# Altium project Pulse Counter_V1.0.PrjPcb
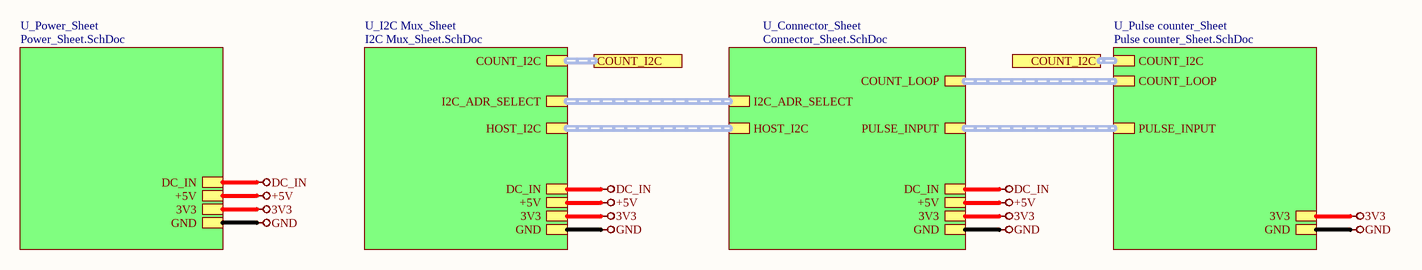
[diagram p0: Top-Sheet.SchDoc]
5 sheets, 96 parts. Net scope: hierarchical (ports join the sheet entries above them; power ports are global).
Board file: PCB1.PcbDoc
Sheets:
  Top-Sheet.SchDoc
    U_Power_Sheet = Power_Sheet.SchDoc
    U_I2C Mux_Sheet = I2C Mux_Sheet.SchDoc
    U_Connector_Sheet = Connector_Sheet.SchDoc
    U_Pulse counter_Sheet = Pulse counter_Sheet.SchDoc

## Sheet Top-Sheet.SchDoc
size A4; SheetNumber: 1; SheetTotal: 5

### Sub-sheets
U_Connector_Sheet = Connector_Sheet.SchDoc: PULSE_INPUT (harness PULSE_INPUT), COUNT_LOOP (harness COUNT_LOOP), I2C_ADR_SELECT (harness I2C_ADR_SELECT), HOST_I2C (harness HOST_I2C), DC_IN, 3V3, GND, +5V
U_I2C Mux_Sheet = I2C Mux_Sheet.SchDoc: COUNT_I2C (harness COUNT_I2C), I2C_ADR_SELECT (harness I2C_ADR_SELECT), HOST_I2C (harness HOST_I2C), DC_IN, 3V3, GND, +5V
U_Power_Sheet = Power_Sheet.SchDoc: DC_IN, +5V, 3V3, GND
U_Pulse counter_Sheet = Pulse counter_Sheet.SchDoc: COUNT_I2C (harness COUNT_I2C), COUNT_LOOP (harness COUNT_LOOP), PULSE_INPUT (harness PULSE_INPUT), 3V3, GND

### Ports
COUNT_I2C

### Nets
3V3: sheet U_Power_Sheet/3V3, sheet U_I2C Mux_Sheet/3V3, sheet U_Connector_Sheet/3V3, sheet U_Pulse counter_Sheet/3V3
+5V: sheet U_Power_Sheet/+5V, sheet U_I2C Mux_Sheet/+5V, sheet U_Connector_Sheet/+5V
DC_IN: sheet U_Power_Sheet/DC_IN, sheet U_I2C Mux_Sheet/DC_IN, sheet U_Connector_Sheet/DC_IN
GND: sheet U_Power_Sheet/GND, sheet U_I2C Mux_Sheet/GND, sheet U_Connector_Sheet/GND, sheet U_Pulse counter_Sheet/GND

### Buses and harness runs
harness port COUNT_I2C = sheet U_I2C Mux_Sheet/COUNT_I2C
harness port COUNT_I2C = sheet U_Pulse counter_Sheet/COUNT_I2C
harness sheet U_Connector_Sheet/COUNT_LOOP = sheet U_Pulse counter_Sheet/COUNT_LOOP
harness sheet U_Connector_Sheet/HOST_I2C = sheet U_I2C Mux_Sheet/HOST_I2C
harness sheet U_Connector_Sheet/I2C_ADR_SELECT = sheet U_I2C Mux_Sheet/I2C_ADR_SELECT
harness sheet U_Connector_Sheet/PULSE_INPUT = sheet U_Pulse counter_Sheet/PULSE_INPUT

### Notes on the sheet
- File:
- Title:
- Date:
- Page
- Num:
- Total:
- Drawn By: Huzaifa Ali

## Sheet Power_Sheet.SchDoc
size A4; SheetNumber: 2; SheetTotal: 5
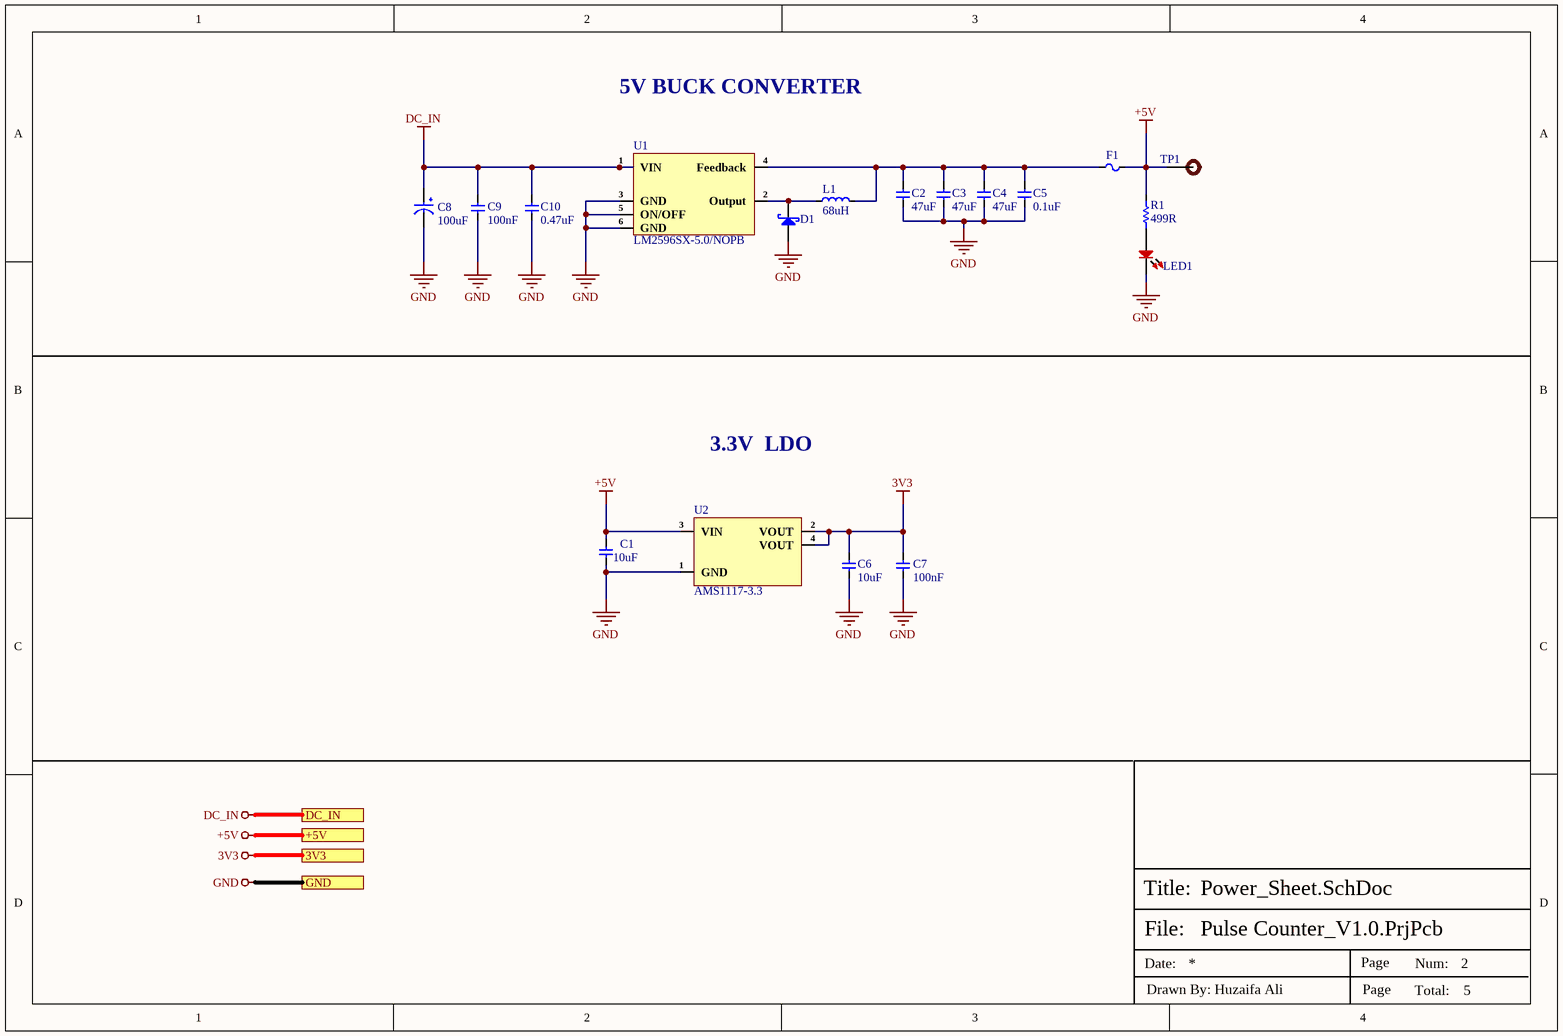
[diagram p1: Power_Sheet.SchDoc]

### Parts
C1  10uF  [Cap-0603]
C2  47uF  [Cap-1206]
C3  47uF  [Cap-1206]
C4  47uF  [Cap-1206]
C5  0.1uF  [Cap-0603]
C6  10uF  [Cap-0603]
C7  100nF  [cap-0402]
C8  100uF  [UUD-100uF-8mmDia]
C9  100nF  [cap-0402]
C10  0.47uF  [Cap-0603]
D1  SS54B-HF  [SMB_]  (value not drawn)
F1  1206L300SLTHYR  [Fuse 1206 (3216 Metric)]  (value not drawn)
L1  68uH  [FCH1365-680M]
LED1  RED  [LED-0603]  (value not drawn)
R1  499R  [Res-0402]
TP1  TEST POINT  [Test-point]  (value not drawn)  (no BOM)
U1  LM2596SX-5.0/NOPB  [DDPAK]
U2  AMS1117-3.3  [SOT- 223]

### Ports
3V3, +5V, DC_IN, GND

### Nets
3V3: C6.2 C7.2 U2.2(VOUT) U2.4(VOUT) ; port 3V3
+5V: C1.2 F1.2 R1.1 TP1.1 U2.3(VIN) ; port +5V
DC_IN: C8.1 C9.2 C10.2 U1.1(VIN) ; port DC_IN
GND: C1.1 C2.1 C3.1 C4.1 C5.1 C6.1 C7.1 C8.2 C9.1 C10.1 D1.1(A) LED1.2 U1.3(GND) U1.5(ON/OFF) U1.6(GND) U2.1(GND) ; port GND
NetC2_2: C2.2 C3.2 C4.2 C5.2 F1.1 L1.2 U1.4(Feedback)
NetD1_2: D1.2(K) L1.1 U1.2(Output)
NetLED1_1: LED1.1 R1.2

### Notes on the sheet
- 5V BUCK CONVERTER
- 3.3V  LDO
- File:
- Title:
- Date:
- Page
- Num:
- Total:
- Drawn By: Huzaifa Ali

### Library data of the parts
C1 C6 = C1608X5R1E106M080AC: CAP CER 10UF 25V X5R 0603; Manufacturer: TDK; Dielectric Material: Ceramic; Tolerance: 20%; Item Type: Capacitor; Supplier 1: Digi-Key; Manufacturer Part Number: C1608X5R1E106M080AC; Stock 1: 61681; Pricing 1: 1=0.96, 10=0.704, 100=0.483, 500=0.38238, 1000=0.322 (USD); Mount: Surface Mount; Case/Package: 0603; Weight: 7.1E-05oz; Case Code (Imperial): 0603; Case Code (Metric): 1608; Min Operating Temperature: -55°C; Max Operating Temperature: 85°C; Capacitance: 10uF; Packaging: Tape and Reel; Voltage Rating: 25V; Voltage Rating (DC): 25V; Termination: SMD/SMT; Package Quantity: 1; Dielectric: X5R; Composition: Ceramic; Length: 1.6mm; Height: 0.8mm; Width: 0.8mm; Thickness: 0.039inch; Depth: 0.8mm; Lead Free: Lead Free; REACH SVHC: No SVHC; Supplier Part Number 1: 445-9015-1-ND; LCSC Part Number: C2168289
C2-C4 = GRM31CR61E476ME44L: CAP CER 47UF 25V X5R 1206; Manufacturer: Murata; Tolerance: 20%; Item Type: Capacitor; Supplier 1: Digi-Key; Manufacturer Part Number: GRM31CR61E476ME44L; RoHS: Yes; Category: Ceramic Capacitors; Capacitance: 47uF; Voltage Rating (DC): 25V; Dielectric: X5R; Length: 3.2mm; Width: 1.6mm; Thickness: 1.6mm; ComponentLink1URL: https://search.murata.co.jp/Ceramy/image/img/A01X/partnumbering_e_01.pdf?src-supplier=Digi-Key; ComponentLink1Description: https://search.murata.co.jp/Ceramy/image/img/A01X/partnumbering_e_01.pdf?src-supplier=Digi-Key; Supplier Part Number 1: 490-16268-2-ND; LCSC Part Number: C403725
C5 = CL10B104KB8WPNC: CAP CER 0.1UF 50V X7R 0603; Item Type: Capacitor; Material: 4241ConductorMaterial; Value: 100nF; Tolerance: 10%; LCSC Part Number: C307348; ComponentLink1Description: LCSC; Supplier: Rs; Supplier Part Number: 2575919; RoHS: Yes; Category: Ceramic Capacitors; Stock: 400; Pricing: 100=0.021, 500=0.019, 1000=0.015, 2000=0.01 (GBP); Mounting Technology: Surface Mount; Case/Package: 0603; Case Code (Metric): 1608; Case Code (Imperial): 0603; Min Operating Temperature: -55°C; Max Operating Temperature: 125°C; Packaging: Cut Tape; Voltage Rating: 50V; Series: CL; Voltage Rating (DC): 50V; Height: 900um; Ratings: AEC-Q200; RoHS Compliant: Yes; Lead Free: 5697LeadFree; ComponentLink2URL: http://www.farnell.com/datasheets/2710560.pdf?src-supplier=Farnell; ComponentLink2Description: http://www.farnell.com/datasheets/2710560.pdf?src-supplier=Farnell; ComponentLink3URL: http://www.samsungsem.com/kr/support/product-search/mlcc/CL10B104KB8WPNC.jsp?src-supplier=Digi-Key; ComponentLink3Description: http://www.samsungsem.com/kr/support/product-search/mlcc/CL10B104KB8WPNC.jsp?src-supplier=Digi-Key; ComponentLink4URL: http://www.farnell.com/datasheets/2710560.pdf?src-supplier=Element14; ComponentLink4Description: http://www.farnell.com/datasheets/2710560.pdf?src-supplier=Element14; ComponentLink5URL: https://datasheet.octopart.com/CL10B104KB8WPNC-Samsung-Electro-Mechanics-datasheet-120093645.pdf?src-supplier=Future+Electronics; ComponentLink5Description: https://datasheet.octopart.com/CL10B104KB8WPNC-Samsung-Electro-Mechanics-datasheet-120093645.pdf?src-supplier=Future+Electronics; ComponentLink6URL: http://www.farnell.com/datasheets/2710560.pdf?src-supplier=Newark; ComponentLink6Description: http://www.farnell.com/datasheets/2710560.pdf?src-supplier=Newark; ComponentLink7URL: http://www.samsungsem.com/servlet/FileDownload?type=spec&file=CL10B104KB8WPNC.pdf&src-supplier=Avnet; ComponentLink7Description: http://www.samsungsem.com/servlet/FileDownload?type=spec&file=CL10B104KB8WPNC.pdf&src-supplier=Avnet; ComponentLink8URL: https://datasheet.octopart.com/CL10B104KB8WPNC-Samsung-datasheet-8326407.pdf?src-supplier=TME; ComponentLink8Description: https://datasheet.octopart.com/CL10B104KB8WPNC-Samsung-datasheet-8326407.pdf?src-supplier=TME
C7 C9 = C1005X7R1H104KT000F: CAP CER 0.1UF 50V X7R 0402; Manufacturer: TDK; Tolerance: 10%; Voltage: 25V; Item Type: Capacitor; Supplier 1: Avnet; Manufacturer Part Number: C1005X7R1H104KT000F; RoHS: No; Category: Ceramic Capacitors; Dielectric: X7R; Supplier Part Number 1: C1005X7R1H104KT000F; LCSC Part Number: C361198; ComponentLink1Description: LCSC; ComponentLink1URL: https://www.lcsc.com/product-detail/Multilayer-Ceramic-Capacitors-MLCC-SMD-SMT_TDK-C1005X7R1H104KT000F_C361198.html
C8 = UUD1H101MNL1GS: CAP ALUM 100UF 20% 50V SMD; Manufacturer: Nichicon; Dielectric Material: Aluminium; Ripple Current: 300mA; Life (Hours): 5000Hour; Impedance: 340mR; Leakage Current: 3uA; Dissipation Factor: 0.14%; Lead Diameter: 1.1mm; Item Type: Capacitor; Supplier 1: Digi-Key; Manufacturer Part Number: UUD1H101MNL1GS; RoHS: Yes; Category: Aluminum Electrolytic Capacitors; Pricing 1: 1=0.62000, 10=0.44000, 50=0.33300, 100=0.29000 (USD); Case/Package: Radial; Number of Pins: 2; Min Operating Temperature: -55°C; Max Operating Temperature: 105°C; Tolerance: 20%; Capacitance: 100uF; Ripple Current (AC): 300mA; Voltage Rating (DC): 50V; Package Quantity: 500; Packaging: Tape and Reel; Voltage Rating: 50V; Termination: SMD/SMT; Voltage: 50V; Series: UD; Construction: Cylindrical; Diameter: 8mm; Length: 10mm; Height: 10mm; Lead Pitch: 3.1mm; Height - Seated (Max): 0.394inch; Radiation Hardening: No; REACH SVHC: No SVHC; Lead Free: Lead Free; RoHS Compliant: Yes; ComponentLink1URL: https://datasheet.ciiva.com/6002/66055-6002224.pdf?src-supplier=Farnell; ComponentLink1Description: https://datasheet.ciiva.com/6002/66055-6002224.pdf?src-supplier=Farnell; ComponentLink2URL: https://datasheet.ciiva.com/11781/0900766b80fa39e7-11781901.pdf?src-supplier=RSComponents; ComponentLink2Description: https://datasheet.ciiva.com/11781/0900766b80fa39e7-11781901.pdf?src-supplier=RSComponents; ComponentLink3URL: https://datasheet.ciiva.com/97/e-ud-97939.pdf?src-supplier=Digi-Key; ComponentLink3Description: https://datasheet.ciiva.com/97/e-ud-97939.pdf?src-supplier=Digi-Key; ComponentLink4URL: https://datasheet.ciiva.com/97/e-ud-97940.pdf?src-supplier=Digi-Key; ComponentLink4Description: https://datasheet.ciiva.com/97/e-ud-97940.pdf?src-supplier=Digi-Key; ComponentLink5URL: https://datasheet.ciiva.com/97/e-ud-97941.pdf?src-supplier=Digi-Key; ComponentLink5Description: https://datasheet.ciiva.com/97/e-ud-97941.pdf?src-supplier=Digi-Key; ComponentLink6URL: https://datasheet.ciiva.com/28458/e-ud-28458117.pdf?src-supplier=Element14; ComponentLink6Description: https://datasheet.ciiva.com/28458/e-ud-28458117.pdf?src-supplier=Element14; ComponentLink7URL: https://datasheet.ciiva.com/28458/1910936-28458133.pdf?src-supplier=Element14; ComponentLink7Description: https://datasheet.ciiva.com/28458/1910936-28458133.pdf?src-supplier=Element14; ComponentLink8URL: https://datasheet.ciiva.com/5362/e-ud-5362134.pdf?src-supplier=Mouser; ComponentLink8Description: https://datasheet.ciiva.com/5362/e-ud-5362134.pdf?src-supplier=Mouser; ComponentLink9URL: https://datasheet.ciiva.com/7781/66055-7781450.pdf?src-supplier=Element14; ComponentLink9Description: https://datasheet.ciiva.com/7781/66055-7781450.pdf?src-supplier=Element14; ComponentLink10URL: https://datasheet.ciiva.com/17354/e-ud-17354671.pdf?src-supplier=Avnet+Europe; ComponentLink10Description: https://datasheet.ciiva.com/17354/e-ud-17354671.pdf?src-supplier=Avnet+Europe; Supplier Part Number 1: 493-2306-6-ND; LCSC Part Number: C116241
C10 = CL10A474KB8NNNC: CAP CER 0.47UF 50V X5R 0603; Manufacturer: Samsung; Tolerance: 10%; Capacitance: 470nF; Supplier 1: Arrow Electronics; Manufacturer Part Number: CL10A474KB8NNNC; RoHS: Yes; Category: Ceramic Capacitors; Stock 1: 196000; Pricing 1: 200000=0.04290, 300000=0.04250, 400000=0.04210, 500000=0.04170, 1000000=0.04120, 2000000=0.04080 (USD); Mount: Surface Mount; Case/Package: 0603; Case Code (Metric): 1608; Case Code (Imperial): 0603; Min Operating Temperature: -55°C; Max Operating Temperature: 85°C; Packaging: Tape and Reel; Package Quantity: 1; Voltage Rating: 50V; Dielectric: X5R; Series: CL; Construction: Flat; Voltage Rating (DC): 50V; Length: 1.6mm; Width: 0.031inch; Height: 0.8mm; Thickness: 0.035inch; Depth: 0.8mm; Radiation Hardening: No; RoHS Compliant: Yes; Lead Free: Lead Free; ComponentLink1URL: https://datasheet.ciiva.com/25798/cl10a474kb8nnnc-25798516.pdf?src-supplier=Digi-Key; ComponentLink1Description: https://datasheet.ciiva.com/25798/cl10a474kb8nnnc-25798516.pdf?src-supplier=Digi-Key; ComponentLink2URL: https://datasheet.ciiva.com/15195/getdatasheetpartid-353290-15195713.pdf?src-supplier=Verical; ComponentLink2Description: https://datasheet.ciiva.com/15195/getdatasheetpartid-353290-15195713.pdf?src-supplier=Verical; Supplier Part Number 1: CL10A474KB8NNNC; LCSC Part Number: C170149
D1 = SS54B-HF: DIODE SCHOTTKY 5A 40V SMB; Manufacturer: Comchip; Supplier 1: Mouser; Manufacturer Part Number: SS54B-HF; RoHS: No; Stock 1: 2862; Pricing 1: 1=0.56000, 10=0.32900, 50=0.32900, 100=0.17100, 1000=0.11900, 10000=0.09000 (USD); Supplier Part Number 1: 750-SS54B-HF; LCSC Part Number: C3759253
F1 = 1206L300SLTHYR: PTC RESET FUSE 6V 3A 1206; Manufacturer: Littelfuse; Max Current Rating: 50A; Resistance: 20mR; Power Dissipation: 800mW; Trip Current: 6A; Time to Trip: 4s; Approvals: UL,TUV; Supplier 1: Arrow Electronics; Manufacturer Part Number: 1206L300SLTHYR; RoHS: Yes; Category: PTC Resettable Fuses; Stock 1: 4000; Pricing 1: 4000=0.60290 (USD); Case/Package: 1206; Case Code (Metric): 3216; Case Code (Imperial): 1206; Min Operating Temperature: -40°C; Max Operating Temperature: 85°C; Package Quantity: 4000; Packaging: Tape and Reel; Termination: SMD/SMT; Max Voltage Rating (DC): 6V; Hold Current: 3A; Voltage Rating (DC): 6V; Operating Supply Voltage: 6V; Series: POLY-FUSE®, LoRho™; Lead Free: Lead Free; RoHS Compliant: Yes; ComponentLink1URL: https://datasheet.ciiva.com/7438/littelfuse-lorho-ptc-7438567.pdf?src-supplier=Digi-Key; ComponentLink1Description: https://datasheet.ciiva.com/7438/littelfuse-lorho-ptc-7438567.pdf?src-supplier=Digi-Key; ComponentLink2URL: https://datasheet.ciiva.com/7438/littelfuse-lorho-ptc-7438569.pdf?src-supplier=Digi-Key; ComponentLink2Description: https://datasheet.ciiva.com/7438/littelfuse-lorho-ptc-7438569.pdf?src-supplier=Digi-Key; ComponentLink3URL: https://datasheet.ciiva.com/7438/littelfuse-lorho-ptc-7438565.pdf?src-supplier=Digi-Key; ComponentLink3Description: https://datasheet.ciiva.com/7438/littelfuse-lorho-ptc-7438565.pdf?src-supplier=Digi-Key; Supplier Part Number 1: 1206L300SLTHYR; LCSC Part Number: C207041; Item Type: Fuse
L1 = FCH1365-680M: 4.5A 68uH Molding Choke ±20% 5.5A SMD,13.7x12.8mm Power Inductors ROHS; Manufacturer: FANGCHENG; Manufacturer Part Number: FCH1365-680M; Package: SMD,13.7x12.8mm; LCSC Part Number: C20415558; Item Type: Inductor; ComponentLink1Description: LCSC; ComponentLink1URL: https://www.lcsc.com/product-detail/Power-Inductors_FANGCHENG-FCH1365-680M_C20415558.html
LED1 = NCD0603R3: RED LED 0603 Light Emitting Diodes; Manufacturer: Foshan NationStar Optoelectronics; Manufacturer Part Number: NCD0603R3; Package: 0603; Item Type: LED; LCSC Part Number: C3151730; ComponentLink1Description: LCSC; ComponentLink1URL: https://www.lcsc.com/product-detail/Light-Emitting-Diodes-LED_Foshan-NationStar-Optoelectronics-NCD0603R3_C3151730.html
R1 = RC0402FR-07499RL: RES 499 OHM 1% 1/16W 0402; Manufacturer: Yageo; Power Rating: 62.5mW; Voltage Rating: 50V; Max Power Dissipation: 63mW; Temperature Coefficient: 100ppm/°C; Supplier 1: Mouser; Manufacturer Part Number: RC0402FR-07499RL; RoHS: Yes; Category: Chip SMD Resistors; Stock 1: 936879; Pricing 1: 1=0.10000, 10=0.01200, 50=0.01200, 100=0.00500, 1000=0.00300, 10000=0.00100 (USD); Case/Package: 0402; Case Code (Metric): 1005; Case Code (Imperial): 0402; Size Code: 0402; Min Operating Temperature: -55°C; Max Operating Temperature: 155°C; Resistance: 499R; Tolerance: 1%; Package Quantity: 1; Packaging: Tape and Reel; Resistor Type: Thick Film; Number of Terminations: 2; Termination: SMD/SMT; Voltage Rating (DC): 50V; Features: Moisture Resistant; Series: RC; Resistance Tolerance: 1%; Construction: Rectangular; Length: 1mm; Width: 0.02inch; Height: 0.016inch; Depth: 0.5mm; RoHS Compliant: Yes; REACH SVHC: No SVHC; Military Standard: Not; Lead Free: Lead Free; ComponentLink1URL: https://datasheet.ciiva.com/2453/pyu-r-int-thick-7-2453539.pdf?src-supplier=Digi-Key; ComponentLink1Description: https://datasheet.ciiva.com/2453/pyu-r-int-thick-7-2453539.pdf?src-supplier=Digi-Key; ComponentLink2URL: https://datasheet.ciiva.com/2453/pyu-r-int-thick-7-2453540.pdf?src-supplier=Digi-Key; ComponentLink2Description: https://datasheet.ciiva.com/2453/pyu-r-int-thick-7-2453540.pdf?src-supplier=Digi-Key; ComponentLink3URL: https://datasheet.ciiva.com/2453/pyu-r-int-thick-7-2453538.pdf?src-supplier=Digi-Key; ComponentLink3Description: https://datasheet.ciiva.com/2453/pyu-r-int-thick-7-2453538.pdf?src-supplier=Digi-Key; Supplier Part Number 1: 603-RC0402FR-07499RL; LCSC Part Number: C137970
TP1 = TEST POINT: Test Point ON; Item Type: TEST POINT
U1 = LM2596SX-5.0/NOPB: IC REG BUCK 5V 3A TO263; Manufacturer: TI National Semiconductor; Min Input Voltage: 4.5V; Max Supply Voltage: 40V; Number of Outputs: 1; Switching Frequency: 150kHz; Efficiency: 80%; Synchronous Rectifier: No; Quiescent Current: 5mA; Output Type: Fixed; Output Configuration: Positive; Number of Channels: 1NUMBER; Supplier: Mouser; LCSC Part Number: C10002; Manufacturer Part Number: LM2596SX-5.0/NOPB; RoHS: Yes; Item Type: IC; Stock: 2657; Pricing: 1=5.76, 10=4.08, 50=4.08, 100=3.71, 1000=3.28, 10000=3.28 (USD); Mounting Technology: Surface Mount; Case/Package: TO-263; Pins: 5; Min Operating Temperature: -40°C; Max Operating Temperature: 125°C; Output Voltage: 5V; Output Current: 3A; Packaging: Tape and Reel; Package Quantity: 500; Nominal Output Voltage: 5V; Min Output Voltage: 5V; Series: SIMPLE SWITCHER®; Thickness: 4.58mm; Reach SVHC Compliant: No; Lead Free: Contains Lead
U2 = AMS1117-3.3: SOT-223 Linear Voltage Regulators (LDO) ROHS; Manufacturer: GUOXIN JIAPIN SEMICONDUCTOR; Item Type: IC; Manufacturer Part Number: AMS1117-3.3; Package: SOT-223; LCSC Part Number: C2992570; ComponentLink1Description: LCSC; ComponentLink1URL: https://www.lcsc.com/product-detail/Linear-Voltage-Regulators-LDO_GUOXIN-JIAPIN-SEMICONDUCTOR-AMS1117-3-3_C2992570.html

## Sheet I2C Mux_Sheet.SchDoc
size A4; SheetNumber: 4; SheetTotal: 5
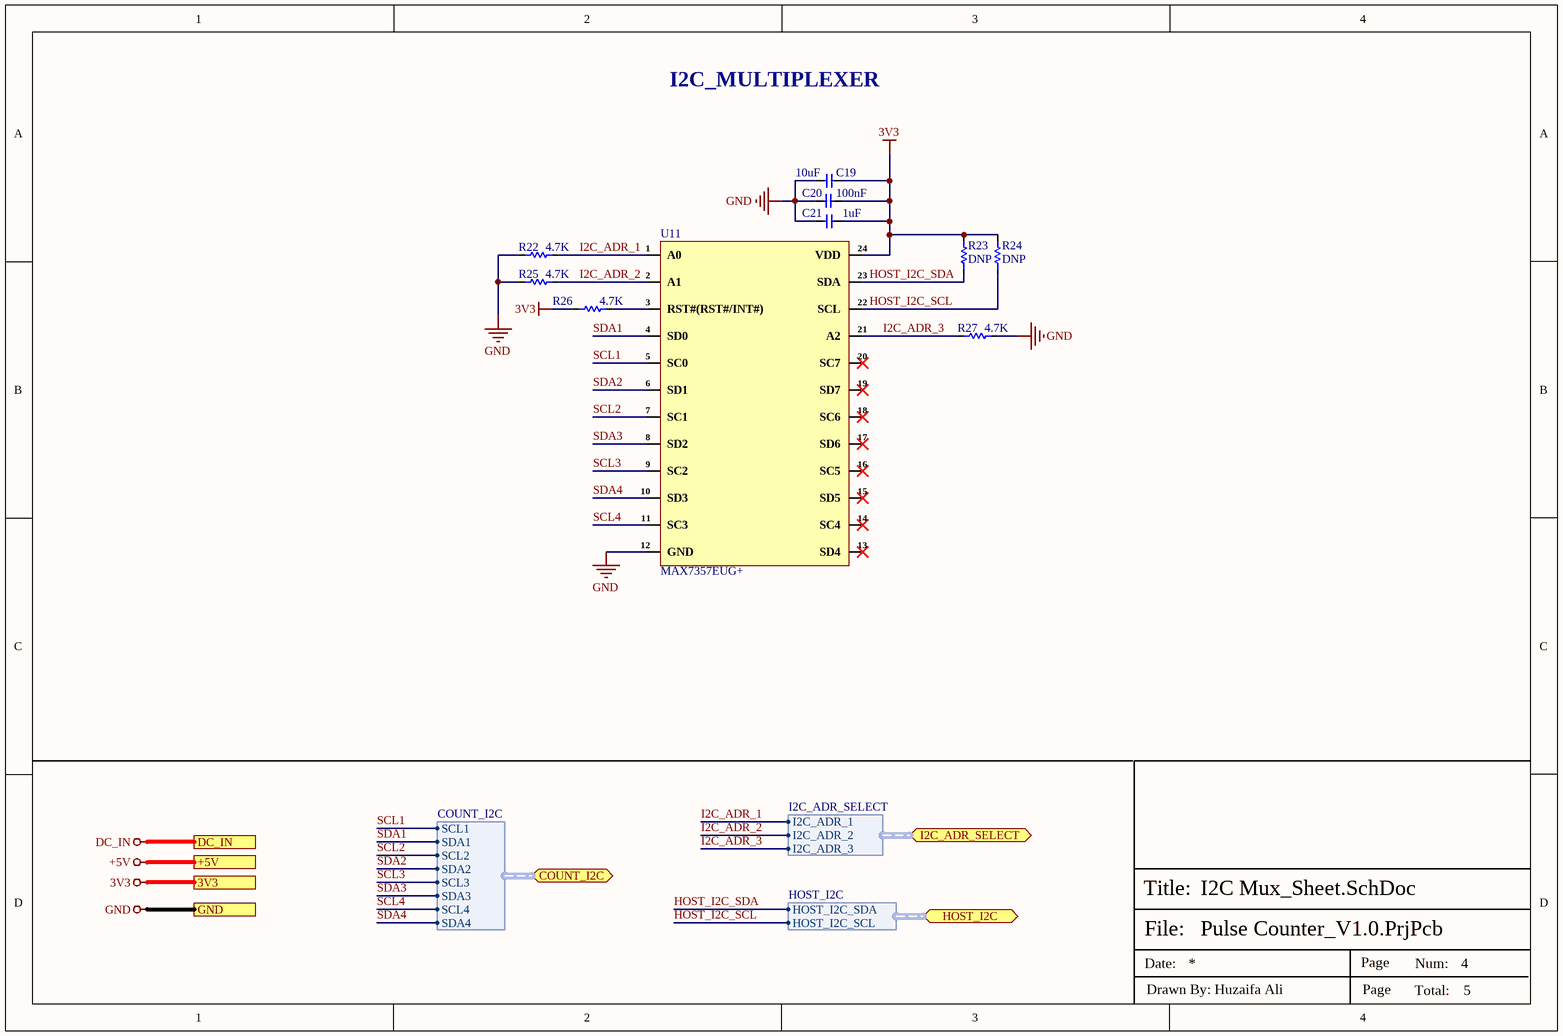
[diagram p2: I2C Mux_Sheet.SchDoc]

### Parts
C19  10uF  [Cap-0603]
C20  100nF  [cap-0402]
C21  1uF  [Cap-0402]
R22  4.7K  [Res-0402]
R23  DNP  [Res-0402]
R24  DNP  [Res-0402]
R25  4.7K  [Res-0402]
R26  4.7K  [Res-0402]
R27  4.7K  [Res-0402]
U11  MAX7357EUG+  [24-TSSOP]

### Ports
3V3, +5V, COUNT_I2C (bidir, harness COUNT_I2C), DC_IN, GND, HOST_I2C (bidir, harness HOST_I2C), I2C_ADR_SELECT (bidir, harness I2C_ADR_SELECT)

### Harnesses
COUNT_I2C: SCL1, SDA1, SCL2, SDA2, SCL3, SDA3, SCL4, SDA4
I2C_ADR_SELECT: I2C_ADR_1, I2C_ADR_2, I2C_ADR_3
HOST_I2C: HOST_I2C_SDA, HOST_I2C_SCL

### Nets
3V3: C19.1 C20.2 C21.1 R23.2 R24.2 R26.1 U11.24(VDD) ; port 3V3
GND: C19.2 C20.1 C21.2 R22.1 R25.1 R27.2 U11.12(GND) ; port GND
HOST_I2C_SCL: R24.1 U11.22(SCL) ; port HOST_I2C.HOST_I2C_SCL
HOST_I2C_SDA: R23.1 U11.23(SDA) ; port HOST_I2C.HOST_I2C_SDA
I2C_ADR_1: R22.2 U11.1(A0) ; port I2C_ADR_SELECT.I2C_ADR_1
I2C_ADR_2: R25.2 U11.2(A1) ; port I2C_ADR_SELECT.I2C_ADR_2
I2C_ADR_3: R27.1 U11.21(A2) ; port I2C_ADR_SELECT.I2C_ADR_3
SCL1: U11.5(SC0) ; port COUNT_I2C.SCL1
SCL2: U11.7(SC1) ; port COUNT_I2C.SCL2
SCL3: U11.9(SC2) ; port COUNT_I2C.SCL3
SCL4: U11.11(SC3) ; port COUNT_I2C.SCL4
SDA1: U11.4(SD0) ; port COUNT_I2C.SDA1
SDA2: U11.6(SD1) ; port COUNT_I2C.SDA2
SDA3: U11.8(SD2) ; port COUNT_I2C.SDA3
SDA4: U11.10(SD3) ; port COUNT_I2C.SDA4
NetR26_2: R26.2 U11.3(RST#(RST#/INT#))

Not connected (* = marked no-connect by the designer): U11 13(SD4)* 14(SC4)* 15(SD5)* 16(SC5)* 17(SD6)* 18(SC6)* 19(SD7)* 20(SC7)*

### Notes on the sheet
- I2C_MULTIPLEXER
- File:
- Title:
- Date:
- Page
- Num:
- Total:
- Drawn By: Huzaifa Ali

### Library data of the parts
C19 = C1608X5R1E106M080AC: as C1 on sheet Power_Sheet; Supplier 1: Digi-Key; Manufacturer Part Number: C1608X5R1E106M080AC; Stock 1: 61681; Pricing 1: 1=0.96, 10=0.704, 100=0.483, 500=0.38238, 1000=0.322 (USD); Mount: Surface Mount; Case/Package: 0603; Weight: 7.1E-05oz; Case Code (Imperial): 0603; Case Code (Metric): 1608; Min Operating Temperature: -55°C; Max Operating Temperature: 85°C; Capacitance: 10uF; Packaging: Tape and Reel; Voltage Rating: 25V; Voltage Rating (DC): 25V; Termination: SMD/SMT; Package Quantity: 1; Dielectric: X5R; Composition: Ceramic; Length: 1.6mm; Height: 0.8mm; Width: 0.8mm; Thickness: 0.039inch; Depth: 0.8mm; Lead Free: Lead Free; REACH SVHC: No SVHC; Supplier Part Number 1: 445-9015-1-ND; LCSC Part Number: C2168289
C20 = C1005X7R1H104KT000F: as C7 on sheet Power_Sheet; Supplier 1: Avnet; Manufacturer Part Number: C1005X7R1H104KT000F; RoHS: No; Category: Ceramic Capacitors; Dielectric: X7R; Supplier Part Number 1: C1005X7R1H104KT000F; LCSC Part Number: C361198; ComponentLink1Description: LCSC; ComponentLink1URL: https://www.lcsc.com/product-detail/Multilayer-Ceramic-Capacitors-MLCC-SMD-SMT_TDK-C1005X7R1H104KT000F_C361198.html
C21 = C1005X5R1V105K050BC: CAP CER 1UF 35V X5R 0402; Manufacturer: TDK; Item Type: Capacitors; Dielectric Material: Ceramic; Material: 4241ConductorMaterial; Tolerance: 10%; Supplier: Digikey; Supplier Part Number: 445-9073-1-ND; Manufacturer Part Number: C1005X5R1V105K050BC; RoHS: Yes; Stock: 682645; Pricing: 1=0.15, 10=0.087, 50=0.061, 100=0.0528, 500=0.03898, 1000=0.03468, 2500=0.03011, 5000=0.02735 (USD); Mounting Technology: Surface Mount; Case/Package: 0402; Case Code (Metric): 1005; Case Code (Imperial): 0402; Min Operating Temperature: -55°C; Max Operating Temperature: 85°C; Value: 1uF; Voltage Rating: 35V; Packaging: Tape and Reel; Dielectric: X5R; Series: C; Length: 1mm; Depth: 0.5mm; Radiation Hardening: No; Reach SVHC Compliant: No; Lead Free: Lead Free; RoHS Compliant: Yes; ComponentLink1URL: https://datasheet.ciiva.com/26834/getdatasheetpartid-750449-26834298.pdf?src-supplier=Verical; ComponentLink1Description: https://datasheet.ciiva.com/26834/getdatasheetpartid-750449-26834298.pdf?src-supplier=Verical; ComponentLink2URL: https://datasheet.ciiva.com/28451/1796654-28451087.pdf?src-supplier=Element14; ComponentLink2Description: https://datasheet.ciiva.com/28451/1796654-28451087.pdf?src-supplier=Element14; ComponentLink3URL: https://datasheet.ciiva.com/22719/1796654-22719533.pdf?src-supplier=Element14; ComponentLink3Description: https://datasheet.ciiva.com/22719/1796654-22719533.pdf?src-supplier=Element14
R22-R27 = RC0402FR-074K7L: RES 4.7K OHM 1% 1/16W 0402; Manufacturer: Yageo; Voltage Rating (DC): 50V; Power Rating: 62.5mW; Resistance: 4.7kR; Temperature Coefficient: 100ppm/°C; Max Power Dissipation: 63mW; Item Type: Resistor; Supplier 1: Avnet; Manufacturer Part Number: RC0402FR-074K7L; RoHS: Yes; Category: Chip SMD Resistors; Stock 1: 2420000; Pricing 1: 10000=0.00085 (USD); Case/Package: 0402; Number of Pins: 2; Case Code (Imperial): 0402; Case Code (Metric): 1005; Size Code: 0402; Min Operating Temperature: -55°C; Max Operating Temperature: 155°C; Tolerance: 1%; Voltage Rating: 50V; Packaging: Tape and Reel; Resistor Type: Thick Film; Termination: SMD/SMT; Features: Moisture Resistant; Series: RC; Number of Terminations: 2; Resistance Tolerance: 1%; Construction: Rectangular; Length: 1mm; Width: 0.5mm; Height: 0.32mm; Depth: 0.5mm; Height - Seated (Max): 0.016inch; RoHS Compliant: Yes; Reach SVHC Compliant: Yes; Military Standard: Not; Lead Free: Lead Free; ComponentLink1URL: https://datasheet.ciiva.com/22661/1686128-22661342.pdf?src-supplier=Element14; ComponentLink1Description: https://datasheet.ciiva.com/22661/1686128-22661342.pdf?src-supplier=Element14; ComponentLink2URL: https://datasheet.ciiva.com/7850/1018594-7850022.pdf?src-supplier=Element14; ComponentLink2Description: https://datasheet.ciiva.com/7850/1018594-7850022.pdf?src-supplier=Element14; ComponentLink3URL: https://datasheet.ciiva.com/7850/1018594-7850023.pdf?src-supplier=Element14; ComponentLink3Description: https://datasheet.ciiva.com/7850/1018594-7850023.pdf?src-supplier=Element14; ComponentLink4URL: https://datasheet.ciiva.com/15215/getdatasheetpartid-328119-15215035.pdf?src-supplier=Verical; ComponentLink4Description: https://datasheet.ciiva.com/15215/getdatasheetpartid-328119-15215035.pdf?src-supplier=Verical; Supplier Part Number 1: RC0402FR-074K7L; LCSC Part Number: C105871
U11 = MAX7357EUG+: IC MULTIPLEXER 8X1 24TSSOP; Manufacturer: Maxim; Supply Type: Single; Propagation Delay: 0.3ns; Max Power Dissipation: 1.11W; Number of Channels: 8; Operating Supply Current: 65uA; Operating Supply Voltage: 5.5V; Supplier: Mouser; LCSC Part Number: C1557096; Manufacturer Part Number: MAX7357EUG+; RoHS: Yes; Category: Interface ICs; Item Type: IC; Pricing: 1=7.78, 10=6.09, 50=4.85, 100=4.47, 1000=4.13, 10000=4.12 (USD); Mounting Technology: Surface Mount; Case/Package: TSSOP; Pins: 24; Min Operating Temperature: -40°C; Max Operating Temperature: 85°C; Packaging: Rail/Tube; Package Quantity: 62; Logic Function: Multiplexer; Series: -; RoHS Compliant: Yes; ComponentLink1URL: https://datasheet.ciiva.com/1676/max7356-max7358-1676412.pdf?src-supplier=Digikey; ComponentLink1Description: https://datasheet.ciiva.com/1676/max7356-max7358-1676412.pdf?src-supplier=Digikey; ComponentLink2URL: https://datasheet.ciiva.com/14295/max7356-max7358-14295500.pdf?src-supplier=Avnet; ComponentLink2Description: https://datasheet.ciiva.com/14295/max7356-max7358-14295500.pdf?src-supplier=Avnet

## Sheet Connector_Sheet.SchDoc
size A4; SheetNumber: 5; SheetTotal: 5
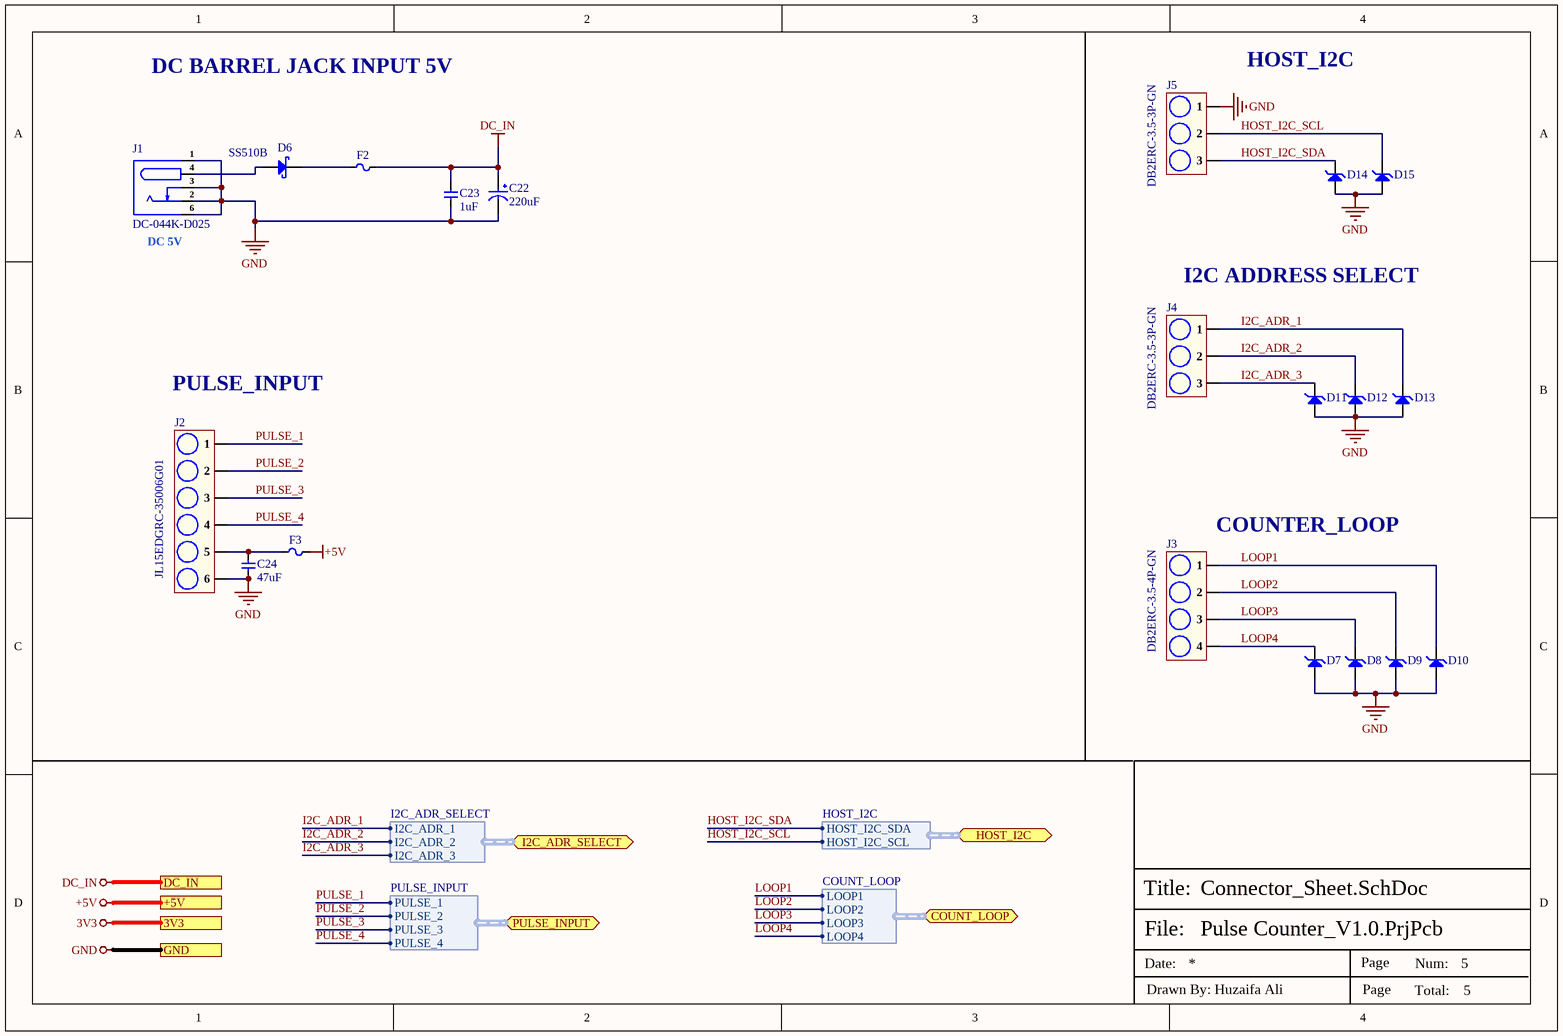
[diagram p3: Connector_Sheet.SchDoc]

### Parts
C22  220uF  [189RV0019]
C23  1uF  [Cap-0805]
C24  47uF  [Cap-1206]
D6  SS510B  [SMB_]
D7  PESDHC3D3V3U  [SOD-323]  (value not drawn)
D8  PESDHC3D3V3U  [SOD-323]  (value not drawn)
D9  PESDHC3D3V3U  [SOD-323]  (value not drawn)
D10  PESDHC3D3V3U  [SOD-323]  (value not drawn)
D11  PESDHC3D3V3U  [SOD-323]  (value not drawn)
D12  PESDHC3D3V3U  [SOD-323]  (value not drawn)
D13  PESDHC3D3V3U  [SOD-323]  (value not drawn)
D14  PESDHC3D3V3U  [SOD-323]  (value not drawn)
D15  PESDHC3D3V3U  [SOD-323]  (value not drawn)
F2  1210L075/24PR  [FUSE-1210]  (value not drawn)
F3  1210L075/24PR  [FUSE-1210]  (value not drawn)
J1  DC-044K-D025  [DC-044K-D025]
J2  JL15EDGRC-35006G01  [JL15EDGRC-35006G01]
J3  DB2ERC-3.5-4P-GN  [DB2ERC-3.5-4P-GN]
J4  DB2ERC-3.5-3P-GN  [DB2ERC-3.5-3P-GN]
J5  DB2ERC-3.5-3P-GN  [DB2ERC-3.5-3P-GN]

### Ports
3V3, +5V, COUNT_LOOP (bidir, harness COUNT_LOOP), DC_IN, GND, HOST_I2C (bidir, harness HOST_I2C), I2C_ADR_SELECT (bidir, harness I2C_ADR_SELECT), PULSE_INPUT (bidir, harness PULSE_INPUT)

### Harnesses
PULSE_INPUT: PULSE_1, PULSE_2, PULSE_3, PULSE_4
COUNT_LOOP: LOOP1, LOOP2, LOOP3, LOOP4
I2C_ADR_SELECT: I2C_ADR_1, I2C_ADR_2, I2C_ADR_3
HOST_I2C: HOST_I2C_SDA, HOST_I2C_SCL

### Nets
+5V: F3.2 ; port +5V
DC_IN: C22.1 C23.2 F2.2 ; port DC_IN
GND: C22.2 C23.1 C24.1 D7.2(A) D8.2(A) D9.2(A) D10.2(A) D11.2(A) D12.2(A) D13.2(A) D14.2(A) D15.2(A) J1.1 J1.2 J1.3 J1.6 J2.6 J5.1 ; port GND
HOST_I2C_SCL: D15.1(C) J5.2 ; port HOST_I2C.HOST_I2C_SCL
HOST_I2C_SDA: D14.1(C) J5.3 ; port HOST_I2C.HOST_I2C_SDA
I2C_ADR_1: D13.1(C) J4.1 ; port I2C_ADR_SELECT.I2C_ADR_1
I2C_ADR_2: D12.1(C) J4.2 ; port I2C_ADR_SELECT.I2C_ADR_2
I2C_ADR_3: D11.1(C) J4.3 ; port I2C_ADR_SELECT.I2C_ADR_3
LOOP1: D10.1(C) J3.1 ; port COUNT_LOOP.LOOP1
LOOP2: D9.1(C) J3.2 ; port COUNT_LOOP.LOOP2
LOOP3: D8.1(C) J3.3 ; port COUNT_LOOP.LOOP3
LOOP4: D7.1(C) J3.4 ; port COUNT_LOOP.LOOP4
PULSE_1: J2.1 ; port PULSE_INPUT.PULSE_1
PULSE_2: J2.2 ; port PULSE_INPUT.PULSE_2
PULSE_3: J2.3 ; port PULSE_INPUT.PULSE_3
PULSE_4: J2.4 ; port PULSE_INPUT.PULSE_4
NetC24_2: C24.2 F3.1 J2.5
NetD6_1: D6.1(A) J1.4
NetD6_2: D6.2(K) F2.1

### Notes on the sheet
- DC BARREL JACK INPUT 5V
- HOST_I2C
- (near J1) DC 5V
- (near J4) I2C ADDRESS SELECT
- (near J2) PULSE_INPUT
- (near J3) COUNTER_LOOP
- File:
- Title:
- Date:
- Page
- Num:
- Total:
- Drawn By: Huzaifa Ali

### Library data of the parts
C22 = 189RV0019: 220uF 35V 600mA@100KHz 160mΩ@100KHz ±20% SMD,D6.3xL7.7mm Aluminum Electrolytic Capacitors - SMD ROHS; Manufacturer: KNSCHA; Manufacturer Part Number: 189RV0019; Package: SMD,D6.3xL7.7mm; LCSC Part Number: C7471881; Item Type: Capacitors; ComponentLink1Description: LCSC; ComponentLink1URL: https://www.lcsc.com/product-detail/Aluminum-Electrolytic-Capacitors-SMD_KNSCHA-189RV0019_C7471881.html
C23 = GCM21BC72A105KE36L: CAP CER 1UF 100V X7S 0805; Manufacturer: Murata; Tolerance: 10%; Supplier 1: Digi-Key; Manufacturer Part Number: GCM21BC72A105KE36L; RoHS: Yes; Category: Ceramic Capacitors; Stock 1: 179138; Pricing 1: 1=0.48000, 10=0.34100, 50=0.25800, 100=0.22480, 500=0.16650, 1000=0.14152 (USD); Mount: Surface Mount; Case/Package: 0805; Case Code (Imperial): 0805; Case Code (Metric): 2012; Min Operating Temperature: -55°C; Max Operating Temperature: 125°C; Packaging: Cut Tape; Capacitance: 1uF; Voltage Rating: 100V; Ratings: AEC-Q200; RoHS Compliant: Yes; ComponentLink1URL: http://search.murata.co.jp/Ceramy/image/img/A01X/partnumbering_e_02.pdf?src-supplier=Digi-Key; ComponentLink1Description: http://search.murata.co.jp/Ceramy/image/img/A01X/partnumbering_e_02.pdf?src-supplier=Digi-Key; Supplier Part Number 1: 490-14436-1-ND; LCSC Part Number: C2842838
C24 = GRM31CR61E476ME44L: as C2 on sheet Power_Sheet; Supplier 1: Digi-Key; Manufacturer Part Number: GRM31CR61E476ME44L; RoHS: Yes; Category: Ceramic Capacitors; Capacitance: 47uF; Voltage Rating (DC): 25V; Dielectric: X5R; Length: 3.2mm; Width: 1.6mm; Thickness: 1.6mm; ComponentLink1URL: https://search.murata.co.jp/Ceramy/image/img/A01X/partnumbering_e_01.pdf?src-supplier=Digi-Key; ComponentLink1Description: https://search.murata.co.jp/Ceramy/image/img/A01X/partnumbering_e_01.pdf?src-supplier=Digi-Key; Supplier Part Number 1: 490-16268-2-ND; LCSC Part Number: C403725
D6 = SS510B: SCHOTTKY DIODE SMB 100V 5A; Manufacturer: MDD; Manufacturer Part Number: SS510B; Package: SMB; ComponentLink1Description: LCSC; ComponentLink1URL: https://www.lcsc.com/product-detail/Schottky-Barrier-Diodes-SBD_JUXING-SS510B_C3011128.html; LCSC Part Number: C3011128; Item Type: Diode
D7-D15 = PESDHC3D3V3U: 15A@8/20us 9V 5V 3.3V Unidirectional SOD-323 TVS ROHS; Manufacturer: Shanghai Prisemi Elec; Item Type: Diode; Manufacturer Part Number: PESDHC3D3V3U; Package: SOD-323; LCSC Part Number: C496538; ComponentLink1Description: LCSC; ComponentLink1URL: https://www.lcsc.com/product-detail/TVS_Shanghai-Prisemi-Elec-PESDHC3D3V3U_C496538.html
F2 F3 = 1210L075/24PR: 24V 750mA 100A 1.5A 1210 Resettable Fuses ROHS; Manufacturer: Littlefuse; Item Type: Fuse; Manufacturer Part Number: 1210L075/24PR; Supplier: Digikey; Supplier Part Number: F4146CT-ND; RoHS: Yes; Category: PTC Resettable Fuses; Stock: 2300; Pricing: 1=0.98, 5=0.81, 10=0.747, 50=0.6196, 100=0.5716, 250=0.51376, 500=0.47378, 1000=0.43676 (USD); Current Rating: 100A; Voltage Rating: 24V; Height: 1.8mm; Lead Free: 5697LeadFree; ComponentLink1URL: https://datasheet.ciiva.com/8005/littelfuse-ptc-1210l-8005372.pdf?src-supplier=Element14; ComponentLink1Description: https://datasheet.ciiva.com/8005/littelfuse-ptc-1210l-8005372.pdf?src-supplier=Element14; ComponentLink2URL: https://datasheet.ciiva.com/326/littelfuse-ptc-1210l-326060.pdf?src-supplier=Digikey; ComponentLink2Description: https://datasheet.ciiva.com/326/littelfuse-ptc-1210l-326060.pdf?src-supplier=Digikey; ComponentLink3URL: https://datasheet.ciiva.com/326/littelfuse-ptc-1210l-326061.pdf?src-supplier=Digikey; ComponentLink3Description: https://datasheet.ciiva.com/326/littelfuse-ptc-1210l-326061.pdf?src-supplier=Digikey; ComponentLink4URL: https://datasheet.ciiva.com/326/littelfuse-ptc-1210l-326062.pdf?src-supplier=Digikey; ComponentLink4Description: https://datasheet.ciiva.com/326/littelfuse-ptc-1210l-326062.pdf?src-supplier=Digikey; LCSC Part Number: C207045
J1 = DC-044K-D025: Bend insert DC Power Receptacle -30℃~+85℃ 2.5mm 6mm 7A 24V Plugin DC Power Connectors ROHS; Manufacturer: G-Switch; Manufacturer Part Number: DC-044K-D025; Package: Plugin; LCSC Part Number: C963204; Item Type: DC Power Connectors; ComponentLink1Description: LCSC; ComponentLink1URL: https://www.lcsc.com/product-detail/DC-Power-Connectors_G-Switch-DC-044K-D025_C963204.html
J2 = JL15EDGRC-35006G01: 300V 8A 6 Bend -40℃~+105℃ 1 3.5mm 1x6P Green Receptacle-Close Push-Pull,P=3.5mm Pluggable System Terminal Block ROHS; Manufacturer: JILN; Manufacturer Part Number: JL15EDGRC-35006G01; Package: Push-Pull,P=3.5mm; LCSC Part Number: C409119; Item Type: Terminal Block; ComponentLink1Description: LCSC; ComponentLink1URL: https://www.lcsc.com/product-detail/Pluggable-System-Terminal-Block_JILN-JL15EDGRC-35006G01_C409119.html
J3 = DB2ERC-3.5-4P-GN: 250V 10A 4 Bend -40℃~+105℃ 1 3.5mm 1x4P Green Receptacle-Close Push-Pull,P=3.5mm Pluggable System Terminal Block ROHS; Manufacturer: DORABO; Manufacturer Part Number: DB2ERC-3.5-4P-GN; Package: Push-Pull,P=3.5mm; LCSC Part Number: C395831; Item Type: Terminal Block; ComponentLink1Description: LCSC; ComponentLink1URL: https://www.lcsc.com/product-detail/Pluggable-System-Terminal-Block_DORABO-DB2ERC-3-5-4P-GN_C395831.html?s_z=n_DB2ERC-3.5-4P
J4 J5 = DB2ERC-3.5-3P-GN: 250V 10A 3 Bend -40℃~+105℃ 1 3.5mm 1x3P Green Board Edge/Receptacle-Close Push-Pull,P=3.5mm Pluggable System Terminal Block ROHS; Manufacturer: DORABO; Manufacturer Part Number: DB2ERC-3.5-3P-GN; Package: Push-Pull,P=5.08mm; LCSC Part Number: C430551; Item Type: Terminal Block; ComponentLink1Description: LCSC; ComponentLink1URL: https://www.lcsc.com/product-detail/Pluggable-System-span-style-background-color-ff0-Terminal-span-span-style-background-color-ff0-Block-span_DORABO-DB2ERC-3-5-3P-GN_C430551.html

## Sheet Pulse counter_Sheet.SchDoc
size A4; SheetNumber: 3; SheetTotal: 5
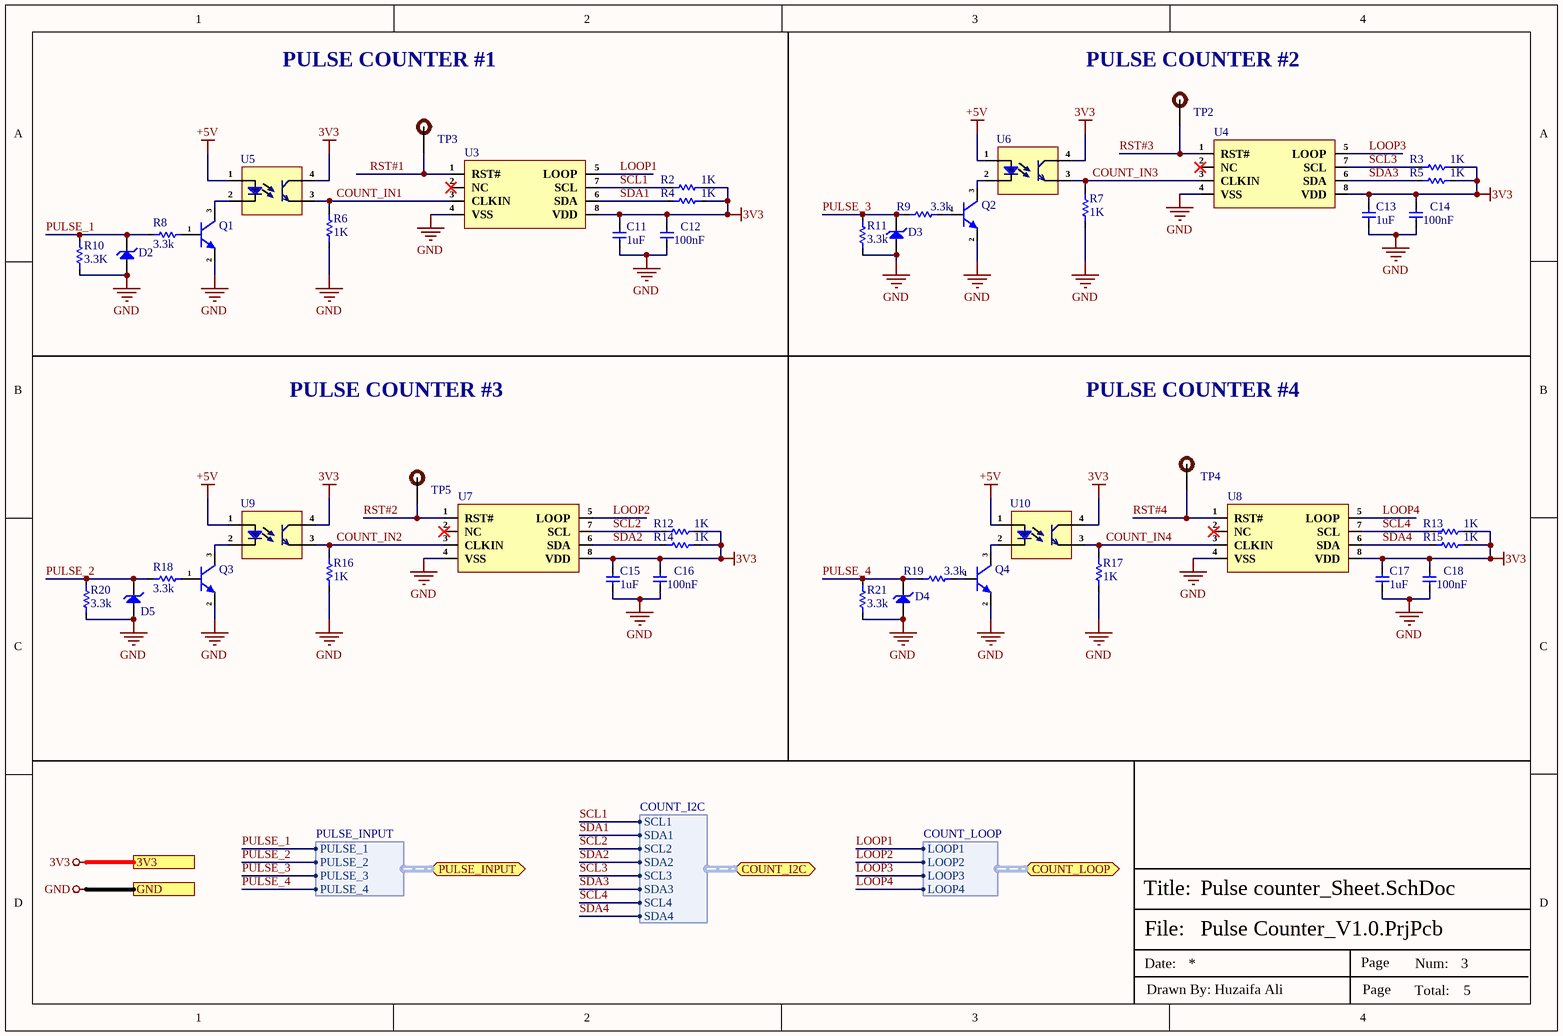
[diagram p4: Pulse counter_Sheet.SchDoc]

### Parts
C11  1uF  [Cap-0402]
C12  100nF  [cap-0402]
C13  1uF  [Cap-0402]
C14  100nF  [cap-0402]
C15  1uF  [Cap-0402]
C16  100nF  [cap-0402]
C17  1uF  [Cap-0402]
C18  100nF  [cap-0402]
D2  AZ4024-01G  [SOD-123]  (value not drawn)
D3  AZ4024-01G  [SOD-123]  (value not drawn)
D4  AZ4024-01G  [SOD-123]  (value not drawn)
D5  AZ4024-01G  [SOD-123]  (value not drawn)
Q1  BC846B(1B)  [SOT-23]  (value not drawn)
Q2  BC846B(1B)  [SOT-23]  (value not drawn)
Q3  BC846B(1B)  [SOT-23]  (value not drawn)
Q4  BC846B(1B)  [SOT-23]  (value not drawn)
R2  1K  [Res-0402]
R3  1K  [Res-0402]
R4  1K  [Res-0402]
R5  1K  [Res-0402]
R6  1K  [Res-0603]
R7  1K  [Res-0603]
R8  3.3k  [Res-0603]
R9  3.3k  [Res-0603]
R10  3.3K  [Res-0603]
R11  3.3k  [Res-0603]
R12  1K  [Res-0402]
R13  1K  [Res-0402]
R14  1K  [Res-0402]
R15  1K  [Res-0402]
R16  1K  [Res-0603]
R17  1K  [Res-0603]
R18  3.3k  [Res-0603]
R19  3.3k  [Res-0603]
R20  3.3k  [Res-0603]
R21  3.3k  [Res-0603]
TP2  TEST POINT 0.5mm Dia  [Test-point - 0.5mm]  (value not drawn)  (no BOM)
TP3  TEST POINT 0.5mm Dia  [Test-point - 0.5mm]  (value not drawn)  (no BOM)
TP4  TEST POINT 0.5mm Dia  [Test-point - 0.5mm]  (value not drawn)  (no BOM)
TP5  TEST POINT 0.5mm Dia  [Test-point - 0.5mm]  (value not drawn)  (no BOM)
U3  (no value)  [8-TMSOP]
U4  (no value)  [8-TMSOP]
U5  (no value)  [SFH617A-2X009T]
U6  (no value)  [SFH617A-2X009T]
U7  (no value)  [8-TMSOP]
U8  (no value)  [8-TMSOP]
U9  (no value)  [SFH617A-2X009T]
U10  (no value)  [SFH617A-2X009T]

### Ports
3V3, COUNT_I2C (bidir, harness COUNT_I2C), COUNT_LOOP (bidir, harness COUNT_LOOP), GND, PULSE_INPUT (bidir, harness PULSE_INPUT)

### Harnesses
COUNT_I2C: SCL1, SDA1, SCL2, SDA2, SCL3, SDA3, SCL4, SDA4
COUNT_LOOP: LOOP1, LOOP2, LOOP3, LOOP4
PULSE_INPUT: PULSE_1, PULSE_2, PULSE_3, PULSE_4

### Nets
3V3: C11.2 C12.2 C13.2 C14.2 C15.2 C16.2 C17.2 C18.2 R2.2 R3.2 R4.2 R5.2 R12.2 R13.2 R14.2 R15.2 U3.8(VDD) U4.8(VDD) U5.4(C) U6.4(C) U7.8(VDD) U8.8(VDD) U9.4(C) U10.4(C) ; port 3V3
+5V: U5.1(An) U6.1(An) U9.1(An) U10.1(An)
GND: C11.1 C12.1 C13.1 C14.1 C15.1 C16.1 C17.1 C18.1 D2.1(A) D3.1(A) D4.1(A) D5.1(A) Q1.2(E) Q2.2(E) Q3.2(E) Q4.2(E) R6.2 R7.2 R10.1 R11.1 R16.2 R17.2 R20.1 R21.1 U3.4(VSS) U4.4(VSS) U7.4(VSS) U8.4(VSS) ; port GND
COUNT_IN1: R6.1 U3.3(CLKIN) U5.3(E)
COUNT_IN2: R16.1 U7.3(CLKIN) U9.3(E)
COUNT_IN3: R7.1 U4.3(CLKIN) U6.3(E)
COUNT_IN4: R17.1 U8.3(CLKIN) U10.3(E)
LOOP1: U3.5(LOOP) ; port COUNT_LOOP.LOOP1
LOOP2: U7.5(LOOP) ; port COUNT_LOOP.LOOP2
LOOP3: U4.5(LOOP) ; port COUNT_LOOP.LOOP3
LOOP4: U8.5(LOOP) ; port COUNT_LOOP.LOOP4
PULSE_1: D2.2(K) R8.1 R10.2 ; port PULSE_INPUT.PULSE_1
PULSE_2: D5.2(K) R18.1 R20.2 ; port PULSE_INPUT.PULSE_2
PULSE_3: D3.2(K) R9.1 R11.2 ; port PULSE_INPUT.PULSE_3
PULSE_4: D4.2(K) R19.1 R21.2 ; port PULSE_INPUT.PULSE_4
RST#1: TP3.1 U3.1(RST#)
RST#2: TP5.1 U7.1(RST#)
RST#3: TP2.1 U4.1(RST#)
RST#4: TP4.1 U8.1(RST#)
SCL1: R2.1 U3.7(SCL) ; port COUNT_I2C.SCL1
SCL2: R12.1 U7.7(SCL) ; port COUNT_I2C.SCL2
SCL3: R3.1 U4.7(SCL) ; port COUNT_I2C.SCL3
SCL4: R13.1 U8.7(SCL) ; port COUNT_I2C.SCL4
SDA1: R4.1 U3.6(SDA) ; port COUNT_I2C.SDA1
SDA2: R14.1 U7.6(SDA) ; port COUNT_I2C.SDA2
SDA3: R5.1 U4.6(SDA) ; port COUNT_I2C.SDA3
SDA4: R15.1 U8.6(SDA) ; port COUNT_I2C.SDA4
NetQ1_1: Q1.1(B) R8.2
NetQ1_3: Q1.3(C) U5.2(Ca)
NetQ2_1: Q2.1(B) R9.2
NetQ2_3: Q2.3(C) U6.2(Ca)
NetQ3_1: Q3.1(B) R18.2
NetQ3_3: Q3.3(C) U9.2(Ca)
NetQ4_1: Q4.1(B) R19.2
NetQ4_3: Q4.3(C) U10.2(Ca)

Not connected (* = marked no-connect by the designer): U3 2(NC)*; U4 2(NC)*; U7 2(NC)*; U8 2(NC)*

### Notes on the sheet
- PULSE COUNTER #1
- (near TP2) PULSE COUNTER #2
- PULSE COUNTER #3
- PULSE COUNTER #4
- File:
- Title:
- Date:
- Page
- Num:
- Total:
- Drawn By: Huzaifa Ali

### Library data of the parts
C11 C13 C15 C17 = C1005X5R1V105K050BC: as C21 on sheet I2C Mux_Sheet; Supplier: Digikey; Supplier Part Number: 445-9073-1-ND; Manufacturer Part Number: C1005X5R1V105K050BC; RoHS: Yes; Stock: 682645; Pricing: 1=0.15, 10=0.087, 50=0.061, 100=0.0528, 500=0.03898, 1000=0.03468, 2500=0.03011, 5000=0.02735 (USD); Mounting Technology: Surface Mount; Case/Package: 0402; Case Code (Metric): 1005; Case Code (Imperial): 0402; Min Operating Temperature: -55°C; Max Operating Temperature: 85°C; Value: 1uF; Voltage Rating: 35V; Packaging: Tape and Reel; Dielectric: X5R; Series: C; Length: 1mm; Depth: 0.5mm; Radiation Hardening: No; Reach SVHC Compliant: No; Lead Free: Lead Free; RoHS Compliant: Yes; ComponentLink1URL: https://datasheet.ciiva.com/26834/getdatasheetpartid-750449-26834298.pdf?src-supplier=Verical; ComponentLink1Description: https://datasheet.ciiva.com/26834/getdatasheetpartid-750449-26834298.pdf?src-supplier=Verical; ComponentLink2URL: https://datasheet.ciiva.com/28451/1796654-28451087.pdf?src-supplier=Element14; ComponentLink2Description: https://datasheet.ciiva.com/28451/1796654-28451087.pdf?src-supplier=Element14; ComponentLink3URL: https://datasheet.ciiva.com/22719/1796654-22719533.pdf?src-supplier=Element14; ComponentLink3Description: https://datasheet.ciiva.com/22719/1796654-22719533.pdf?src-supplier=Element14
C12 C14 C16 C18 = C1005X7R1H104KT000F: as C7 on sheet Power_Sheet; Supplier 1: Avnet; Manufacturer Part Number: C1005X7R1H104KT000F; RoHS: No; Category: Ceramic Capacitors; Dielectric: X7R; Supplier Part Number 1: C1005X7R1H104KT000F; LCSC Part Number: C361198; ComponentLink1Description: LCSC; ComponentLink1URL: https://www.lcsc.com/product-detail/Multilayer-Ceramic-Capacitors-MLCC-SMD-SMT_TDK-C1005X7R1H104KT000F_C361198.html
D2-D5 = AZ4024-01G: 26.7V 24V SOD-123 ESD and Surge Protection (TVS/ESD) ROHS; Manufacturer: AMAZING; Manufacturer Part Number: AZ4024-01G; Package: SOD-123; LCSC Part Number: C5571859; Item Type: (TVS/ESD); ComponentLink1Description: LCSC; ComponentLink1URL: https://www.lcsc.com/product-detail/ESD-and-Surge-Protection-TVS-ESD_AMAZING-AZ4024-01G_C5571859.html
Q1-Q4 = BC846B(1B): 65V 300mW 200@2mA,5V 100mA NPN SOT-23 Bipolar Transistors - BJT ROHS; Manufacturer: ST(Semtech); Manufacturer Part Number: BC846B(1B); Package: SOT-23; LCSC Part Number: C118727; Item Type: Transistor; ComponentLink1Description: LCSC; ComponentLink1URL: https://www.lcsc.com/product-detail/Transistors-NPN-PNP_ST-Semtech-BC846B-1B_C118727.html
R2-R5 R12-R15 = RC0402JR-071KL: RES 1K OHM 5% 1/16W 0402; Manufacturer: Yageo; Resistance: 1kR; Power Rating: 62.5mW; Voltage Rating: 50V; Temperature Coefficient: 100ppm/°C; Max Power Dissipation: 63mW; Item Type: Resistor; Supplier 1: Digi-Key; Manufacturer Part Number: RC0402JR-071KL; RoHS: Yes; Category: Chip SMD Resistors; Stock 1: 452315; Pricing 1: 1=0.10000, 10=0.01300, 100=0.00540, 1000=0.00244, 2500=0.00212, 5000=0.00175 (USD); Case/Package: 0402; Case Code (Imperial): 0402; Case Code (Metric): 1005; Size Code: 0402; Min Operating Temperature: -55°C; Max Operating Temperature: 155°C; Tolerance: 5%; Packaging: Tape and Reel; Package Quantity: 1; Termination: SMD/SMT; Resistor Type: Thick Film; Number of Terminations: 2; Features: Moisture Resistant; Series: RC; Resistance Tolerance: 5%; Construction: Rectangular; Length: 0.039inch; Width: 0.02inch; Height: 0.016inch; Depth: 0.5mm; REACH SVHC: No SVHC; Military Standard: Not; Lead Free: Lead Free; RoHS Compliant: Yes; ComponentLink1URL: https://datasheet.ciiva.com/7983/1018594-7983558.pdf?src-supplier=Element14; ComponentLink1Description: https://datasheet.ciiva.com/7983/1018594-7983558.pdf?src-supplier=Element14; ComponentLink2URL: https://datasheet.ciiva.com/2452/pyu-r-int-thick-7-2452756.pdf?src-supplier=Digi-Key; ComponentLink2Description: https://datasheet.ciiva.com/2452/pyu-r-int-thick-7-2452756.pdf?src-supplier=Digi-Key; ComponentLink3URL: https://datasheet.ciiva.com/2452/pyu-r-int-thick-7-2452757.pdf?src-supplier=Digi-Key; ComponentLink3Description: https://datasheet.ciiva.com/2452/pyu-r-int-thick-7-2452757.pdf?src-supplier=Digi-Key; ComponentLink4URL: https://datasheet.ciiva.com/2452/pyu-r-int-thick-7-2452755.pdf?src-supplier=Digi-Key; ComponentLink4Description: https://datasheet.ciiva.com/2452/pyu-r-int-thick-7-2452755.pdf?src-supplier=Digi-Key; ComponentLink5URL: https://datasheet.ciiva.com/7850/1018594-7850170.pdf?src-supplier=Element14; ComponentLink5Description: https://datasheet.ciiva.com/7850/1018594-7850170.pdf?src-supplier=Element14; ComponentLink6URL: https://datasheet.ciiva.com/7850/1018594-7850171.pdf?src-supplier=Element14; ComponentLink6Description: https://datasheet.ciiva.com/7850/1018594-7850171.pdf?src-supplier=Element14; ComponentLink7URL: https://datasheet.ciiva.com/17081/pyu-rc0402-51-rohs-l-6-r-17081438.pdf?src-supplier=Future+Electronics; ComponentLink7Description: https://datasheet.ciiva.com/17081/pyu-rc0402-51-rohs-l-6-r-17081438.pdf?src-supplier=Future+Electronics; Supplier Part Number 1: 311-1.0KJRCT-ND; LCSC Part Number: C105637
R6 R7 R16 R17 = CRCW06031K00FKEA: RES SMD 1K OHM 1% 1/10W 0603; Manufacturer: Vishay Dale; Item Type: Resistor; Value: 1kR; Voltage Rating: 75V; Temperature Coefficient: 100ppm/°C; Power Rating: 100mW; LCSC Part Number: C844920; ComponentLink2URL: https://datasheet.ciiva.com/11808/0900766b80d98afc-11808625.pdf?src-supplier=Rs; ComponentLink2Description: https://datasheet.ciiva.com/11808/0900766b80d98afc-11808625.pdf?src-supplier=Rs; ComponentLink3URL: https://datasheet.ciiva.com/46441/1720486-46441623.pdf?src-supplier=Element14; ComponentLink3Description: https://datasheet.ciiva.com/46441/1720486-46441623.pdf?src-supplier=Element14; ComponentLink4URL: https://datasheet.ciiva.com/46441/1720486-46441622.pdf?src-supplier=Element14; ComponentLink4Description: https://datasheet.ciiva.com/46441/1720486-46441622.pdf?src-supplier=Element14; ComponentLink5URL: https://datasheet.ciiva.com/26316/fld-crcw-e3-data-en-26316551.pdf?src-supplier=Distrelec; ComponentLink5Description: https://datasheet.ciiva.com/26316/fld-crcw-e3-data-en-26316551.pdf?src-supplier=Distrelec; ComponentLink6URL: https://datasheet.ciiva.com/2465/dcrcwe3-2465536.pdf?src-supplier=Digi-Key; ComponentLink6Description: https://datasheet.ciiva.com/2465/dcrcwe3-2465536.pdf?src-supplier=Digi-Key; ComponentLink7URL: https://datasheet.ciiva.com/2465/dcrcwe3-2465534.pdf?src-supplier=Digi-Key; ComponentLink7Description: https://datasheet.ciiva.com/2465/dcrcwe3-2465534.pdf?src-supplier=Digi-Key; ComponentLink8URL: https://datasheet.ciiva.com/16199/dcrcwe3-16199053.pdf?src-supplier=Future+Electronics; ComponentLink8Description: https://datasheet.ciiva.com/16199/dcrcwe3-16199053.pdf?src-supplier=Future+Electronics; ComponentLink9URL: https://datasheet.ciiva.com/46385/1697337-46385497.pdf?src-supplier=Element14; ComponentLink9Description: https://datasheet.ciiva.com/46385/1697337-46385497.pdf?src-supplier=Element14; ComponentLink10URL: https://datasheet.ciiva.com/2465/dcrcwe3-2465535.pdf?src-supplier=Digi-Key; ComponentLink10Description: https://datasheet.ciiva.com/2465/dcrcwe3-2465535.pdf?src-supplier=Digi-Key; ComponentLink11URL: https://datasheet.ciiva.com/8336/dcrcwe3-8336822.pdf?src-supplier=Avnet; ComponentLink11Description: https://datasheet.ciiva.com/8336/dcrcwe3-8336822.pdf?src-supplier=Avnet; ComponentLink12URL: https://datasheet.ciiva.com/3257/dcrcwe3-3257132.pdf?src-supplier=Avnet; ComponentLink12Description: https://datasheet.ciiva.com/3257/dcrcwe3-3257132.pdf?src-supplier=Avnet; Supplier: Mouser; Supplier Part Number: 71-CRCW0603-1.0K-E3; Manufacturer Part Number: CRCW06031K00FKEA; RoHS: Yes; Category: Chip SMD Resistors; Stock: 1295653; Pricing: 1=0.1, 10=0.017, 50=0.017, 100=0.01, 1000=0.008, 10000=0.004 (USD); Case/Package: 0603; Pins: 2; Contact Plating: Tin; Weight: 7.1E-05oz; Case Code (Metric): 1608; Case Code (Imperial): 0603; Min Operating Temperature: -55°C; Max Operating Temperature: 155°C; Tolerance: 1%; Resistor Type: Thick Film; Packaging: Tape and Reel; Package Quantity: 5000; Number of Terminations: 2; Termination: SMD/SMT; Max Power Dissipation: 100mW; Features: Automotive AEC-Q200; Series: CRCW; Technology: THICK FILM; Resistance Tolerance: 1%; Voltage Rating (DC): 75V; Construction: Rectangular; Length: 1.55mm; Width: 0.85mm; Height: 0.45mm; Depth: 0.85mm; Ratings: AEC-Q200; Radiation Hardening: No; RoHS Compliant: Yes; Reach SVHC Compliant: Unknown; Lead Free: 5697LeadFree; Military Standard: Not; ComponentLink1URL: https://datasheet.ciiva.com/11808/0900766b80d98afc-11808625.pdf?src-supplier=Rs; ComponentLink1Description: https://datasheet.ciiva.com/11808/0900766b80d98afc-11808625.pdf?src-supplier=Rs; ComponentLink13URL: https://datasheet.ciiva.com/2465/dcrcwe3-2465535.pdf?src-supplier=Digikey; ComponentLink13Description: https://datasheet.ciiva.com/2465/dcrcwe3-2465535.pdf?src-supplier=Digikey; ComponentLink14URL: https://datasheet.ciiva.com/2465/dcrcwe3-2465536.pdf?src-supplier=Digikey; ComponentLink14Description: https://datasheet.ciiva.com/2465/dcrcwe3-2465536.pdf?src-supplier=Digikey; ComponentLink15URL: https://datasheet.ciiva.com/2465/dcrcwe3-2465534.pdf?src-supplier=Digikey; ComponentLink15Description: https://datasheet.ciiva.com/2465/dcrcwe3-2465534.pdf?src-supplier=Digikey
R8-R11 R18-R21 = SR0603JR-7T3K3L: 250mW Thick Film Resistors 75V ±100ppm/℃ ±5% 3.3kΩ 0603 Chip Resistor - Surface Mount ROHS; Manufacturer: Yageo; Supplier: Future Electronics; LCSC Part Number: C873727; Manufacturer Part Number: SR0603JR-7T3K3L; RoHS: Yes; Item Type: Resistors; Stock: 10000; Pricing: 5000=0.0081, 15000=0.0078, 25000=0.0077, 100000=0.0074, 150000=0.0073 (USD); ComponentLink1Description: LCSC; ComponentLink1URL: https://www.lcsc.com/product-detail/Chip-Resistor-Surface-Mount_YAGEO-SR0603JR-7T3K3L_C873727.html
TP2-TP5 = TEST POINT 0.5mm Dia: Test Point ON; Item Type: Test Point; Manufacturer Part Number: TEST POINT 0.5mm Dia
U3 U4 U7 U8 = S-35770E01I-K8T2U: IC OSC 2-WIRE TIMER 1MHZ 8TMSOP; Manufacturer: ABLIC; Supplier: Digikey; LCSC Part Number: C2666930; Manufacturer Part Number: S-35770E01I-K8T2U; RoHS: Yes; Item Type: IC; Stock: 2912; Pricing: 1=7.55, 10=5.036, 25=4.3812, 100=3.6411, 250=3.27772, 500=3.13 (USD)
U5 U6 U9 U10 = SFH617A-2X009T: OPTOISOLATOR 5.3KV TRANS 4SMD; Manufacturer: Vishay; Item Type: IC; Supplier: Arrow Electronics; LCSC Part Number: C5334420; Manufacturer Part Number: SFH617A-2X009T; RoHS: Yes; Stock: 871; Pricing: 1=0.3234, 10=0.3216, 25=0.3197, 100=0.3179, 250=0.3161, 500=0.3142 (USD); ComponentLink1URL: https://datasheet.ciiva.com/18616/options-18616575.pdf?src-supplier=Digikey; ComponentLink1Description: https://datasheet.ciiva.com/18616/options-18616575.pdf?src-supplier=Digikey

## Nets that join several sheets
3V3: Power_Sheet (C6.2 C7.2 U2.2 U2.4), I2C Mux_Sheet (7 pins), Pulse counter_Sheet (24 pins)
+5V: Power_Sheet (5 pins), Connector_Sheet (F3.2), Pulse counter_Sheet (U5.1 U6.1 U9.1 U10.1)
DC_IN: Power_Sheet (C8.1 C9.2 C10.2 U1.1), Connector_Sheet (C22.1 C23.2 F2.2)
GND: Power_Sheet (16 pins), I2C Mux_Sheet (7 pins), Connector_Sheet (18 pins), Pulse counter_Sheet (28 pins)
HOST_I2C_SCL: I2C Mux_Sheet (R24.1 U11.22), Connector_Sheet (D15.1 J5.2)
HOST_I2C_SDA: I2C Mux_Sheet (R23.1 U11.23), Connector_Sheet (D14.1 J5.3)
I2C_ADR_1: I2C Mux_Sheet (R22.2 U11.1), Connector_Sheet (D13.1 J4.1)
I2C_ADR_2: I2C Mux_Sheet (R25.2 U11.2), Connector_Sheet (D12.1 J4.2)
I2C_ADR_3: I2C Mux_Sheet (R27.1 U11.21), Connector_Sheet (D11.1 J4.3)
LOOP1: Connector_Sheet (D10.1 J3.1), Pulse counter_Sheet (U3.5)
LOOP2: Connector_Sheet (D9.1 J3.2), Pulse counter_Sheet (U7.5)
LOOP3: Connector_Sheet (D8.1 J3.3), Pulse counter_Sheet (U4.5)
LOOP4: Connector_Sheet (D7.1 J3.4), Pulse counter_Sheet (U8.5)
PULSE_1: Connector_Sheet (J2.1), Pulse counter_Sheet (D2.2 R8.1 R10.2)
PULSE_2: Connector_Sheet (J2.2), Pulse counter_Sheet (D5.2 R18.1 R20.2)
PULSE_3: Connector_Sheet (J2.3), Pulse counter_Sheet (D3.2 R9.1 R11.2)
PULSE_4: Connector_Sheet (J2.4), Pulse counter_Sheet (D4.2 R19.1 R21.2)
SCL1: I2C Mux_Sheet (U11.5), Pulse counter_Sheet (R2.1 U3.7)
SCL2: I2C Mux_Sheet (U11.7), Pulse counter_Sheet (R12.1 U7.7)
SCL3: I2C Mux_Sheet (U11.9), Pulse counter_Sheet (R3.1 U4.7)
SCL4: I2C Mux_Sheet (U11.11), Pulse counter_Sheet (R13.1 U8.7)
SDA1: I2C Mux_Sheet (U11.4), Pulse counter_Sheet (R4.1 U3.6)
SDA2: I2C Mux_Sheet (U11.6), Pulse counter_Sheet (R14.1 U7.6)
SDA3: I2C Mux_Sheet (U11.8), Pulse counter_Sheet (R5.1 U4.6)
SDA4: I2C Mux_Sheet (U11.10), Pulse counter_Sheet (R15.1 U8.6)